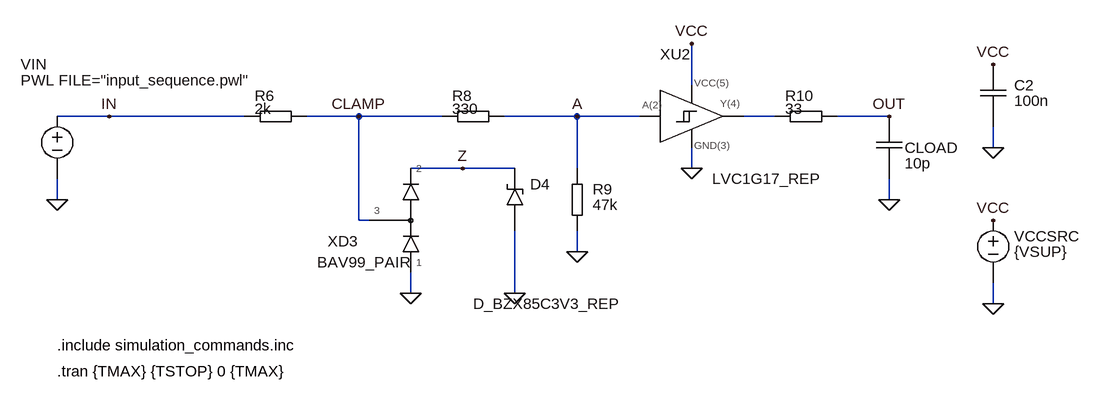
[diagram p0: schematic input_protection_1ch.asc]
input_protection_1ch.asc, the LTspice schematic file:
Version 4
SHEET 1 1760 720
WIRE 480 240 560 240
WIRE 560 240 688 240
WIRE 784 240 896 240
WIRE 896 240 992 240
WIRE 1152 240 1200 240
WIRE 1296 240 1376 240
FLAG 176 240 IN
WIRE 96 240 176 240
WIRE 176 240 384 240
FLAG 560 240 CLAMP
FLAG 896 240 A
FLAG 1376 240 OUT
WIRE 560 240 560 400
WIRE 560 400 576 400
FLAG 720 320 Z
WIRE 640 320 720 320
WIRE 720 320 800 320
WIRE 640 480 640 512
FLAG 640 512 0
WIRE 800 416 800 512
FLAG 800 512 0
WIRE 896 240 896 320
WIRE 896 416 896 448
FLAG 896 448 0
WIRE 1072 192 1072 128
FLAG 1072 128 VCC
WIRE 1072 288 1072 320
FLAG 1072 320 0
WIRE 1376 336 1376 368
FLAG 1376 368 0
WIRE 96 336 96 368
FLAG 96 368 0
WIRE 1536 256 1536 288
FLAG 1536 160 VCC
FLAG 1536 288 0
FLAG 1536 400 VCC
WIRE 1536 496 1536 528
FLAG 1536 528 0
SYMBOL la_source 96 240 R0
WINDOW 0 -56 -80 Left 2
WINDOW 3 -56 -56 Left 2
SYMATTR InstName VIN
SYMATTR Value PWL FILE="input_sequence.pwl"
SYMBOL la_res_h 384 240 R0
WINDOW 0 16 -32 Left 2
WINDOW 3 16 -12 Left 2
SYMATTR InstName R6
SYMATTR Value 2k
SYMBOL la_res_h 688 240 R0
WINDOW 0 16 -32 Left 2
WINDOW 3 16 -12 Left 2
SYMATTR InstName R8
SYMATTR Value 330
SYMBOL la_res_v 896 320 R0
WINDOW 0 24 32 Left 2
WINDOW 3 24 56 Left 2
SYMATTR InstName R9
SYMATTR Value 47k
SYMBOL la_res_h 1200 240 R0
WINDOW 0 16 -32 Left 2
WINDOW 3 16 -12 Left 2
SYMATTR InstName R10
SYMATTR Value 33
SYMBOL la_bav99 640 320 R0
WINDOW 0 -128 112 Left 2
WINDOW 3 -144 144 Left 2
SYMATTR InstName XD3
SYMATTR Value BAV99_PAIR
SYMBOL la_zener 800 320 R0
WINDOW 0 24 24 Left 2
WINDOW 3 -64 208 Left 2
SYMATTR InstName D4
SYMATTR Value D_BZX85C3V3_REP
SYMBOL la_schmitt 992 192 R0
WINDOW 0 32 -48 Left 2
WINDOW 3 112 144 Left 2
SYMATTR InstName XU2
SYMATTR Value LVC1G17_REP
SYMBOL la_cap_v 1536 160 R0
WINDOW 0 32 32 Left 2
WINDOW 3 32 56 Left 2
SYMATTR InstName C2
SYMATTR Value 100n
SYMBOL la_source 1536 400 R0
WINDOW 0 32 24 Left 2
WINDOW 3 32 48 Left 2
SYMATTR InstName VCCSRC
SYMATTR Value {VSUP}
SYMBOL la_cap_v 1376 240 R0
WINDOW 0 24 48 Left 2
WINDOW 3 24 72 Left 2
SYMATTR InstName CLOAD
SYMATTR Value 10p
TEXT 96 592 Left 2 !.include simulation_commands.inc
TEXT 96 632 Left 2 !.tran {TMAX} {TSTOP} 0 {TMAX}

The netlist it stands for:
* input_protection_1ch.asc
VIN IN 0 PWL FILE="input_sequence.pwl"
R6 IN CLAMP 2k
R8 CLAMP A 330
R9 A 0 47k
R10 N001 OUT 33
XXD3 0 Z CLAMP BAV99_PAIR  ; pins 1_GND 2_ZENER 3_CLAMP
D4 0 Z D_BZX85C3V3_REP
XXU2 A N001 VCC 0 LVC1G17_REP  ; pins A Y VCC GND
C2 VCC 0 100n
VCCSRC VCC 0 {VSUP}
CLOAD OUT 0 10p
.model D D
.lib standard.dio
.include simulation_commands.inc
.tran {TMAX} {TSTOP} 0 {TMAX}
.backanno
.end